# Altium schematic sheet Com.SchDoc
size A4; SheetNumber: 3; SheetTotal: 3
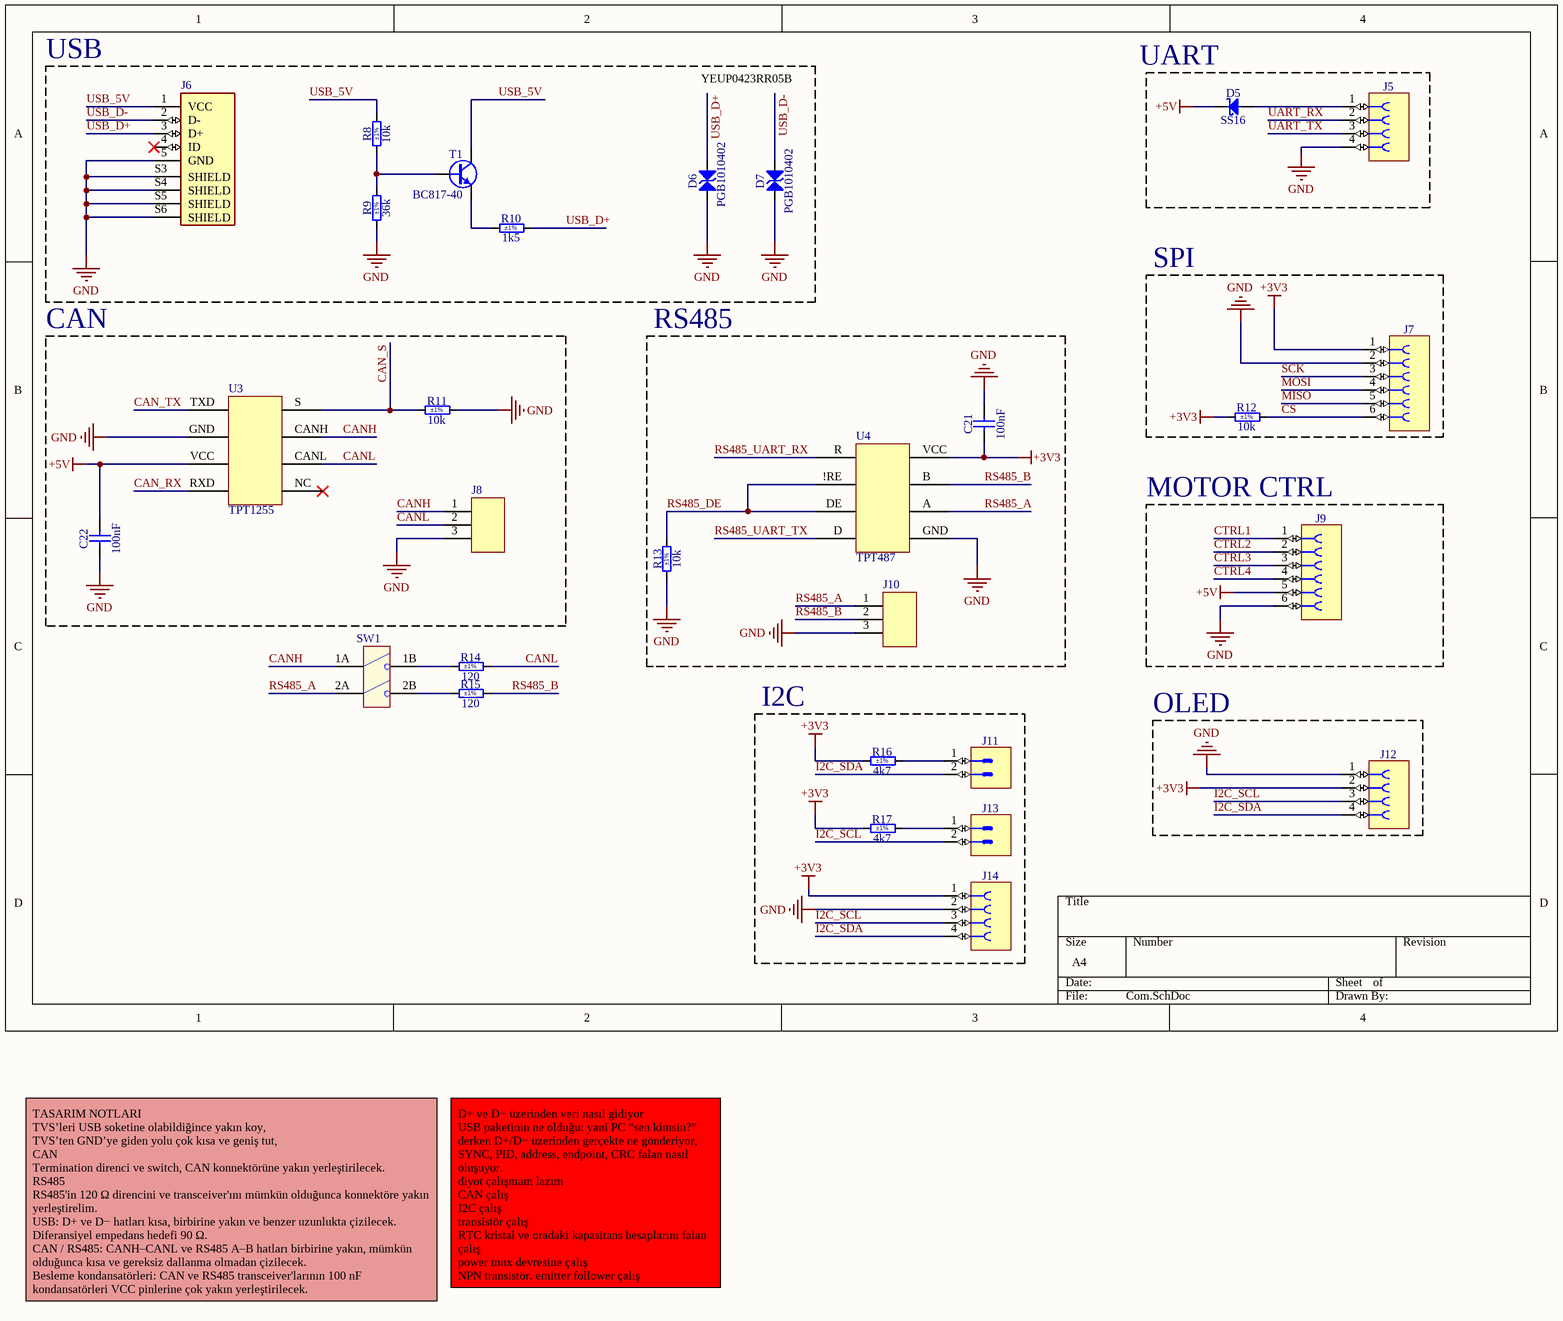
[diagram p0: Com.SchDoc]

## Parts
C21  100nF  [CAPC1608X87N]
C22  100nF  [CAPC1608X87N]
D5  SS16  [DIOM5127X229N]
D6  PGB1010402  [LITTELFUSE_PGB1010402]
D7  PGB1010402  [LITTELFUSE_PGB1010402]
J5  Socket 4  [SAMTEC_SSW-104-02-L-S]  (value not drawn)
J6  USB Micro B 5 Pin Female  [USB MICRO B]  (value not drawn)
J7  Socket 6  [SAMTEC_SSW-106-01-L-S]  (value not drawn)
J8  3 pin female header  [3 pin female hedaer]  (value not drawn)
J9  Socket 6  [SAMTEC_SSW-106-01-L-S]  (value not drawn)
J10  3 pin female header  [3 pin female hedaer]  (value not drawn)
J11  Header 2  [SAMTEC_HTSW-101-23-L-D]  (value not drawn)
J12  Socket 4  [SAMTEC_SSW-104-02-L-S]  (value not drawn)
J13  Header 2  [SAMTEC_HTSW-101-23-L-D]  (value not drawn)
J14  Socket 4  [SAMTEC_SSW-104-02-L-S]  (value not drawn)
R8  10k  Tolerance: ±1%  [RESC1608X55N]
R9  36k  Tolerance: ±1%  [RESC1608X55N]
R10  1k5  Tolerance: ±1%  [RESC1608X55N]
R11  10k  Tolerance: ±1%  [RESC1608X55N]
R12  10k  Tolerance: ±1%  [RESC1608X55N]
R13  10k  Tolerance: ±1%  [RESC1608X55N]
R14  120  Tolerance: ±1%  [RESC1608X55N]
R15  120  Tolerance: ±1%  [RESC1608X55N]
R16  4k7  Tolerance: ±1%  [RESC1608X55N]
R17  4k7  Tolerance: ±1%  [RESC1608X55N]
SW1  DS1040  [DS1040 2-DIP SW]  (value not drawn)
T1  BC817-40  [SOT95P230X110-3N]
U3  TPT1255  [TPT1255]
U4  TPT487  [TPT487]

## Blocks framed on the sheet
USB: D6 D7 J6 R8-R10 T1
SPI: J7 R12
CAN: C22 J8 R11 U3
MOTOR CTRL: J9
I2C: J11 J13 J14 R16 R17
OLED: J12

## Nets
+3V3: C21.1 J7.1 J12.2 J14.1 R12.1 R16.1 R17.1 U4.VCC
+5V: C22.2 D5.1(C) J9.5 U3.VCC
GND: C21.2 C22.1 D6.1 D7.1 J5.4 J6.5(GND) J6.S3(SHIELD) J6.S4(SHIELD) J6.S5(SHIELD) J6.S6(SHIELD) J7.2 J8.3 J9.6 J10.3 J12.1 J14.2 R9.1 R11.2 R13.1 U3.GND U4.GND
CAN_RX: U3.RXD
CAN_S: R11.1 U3.S
CAN_TX: U3.TXD
CANH: J8.1 SW1.1A(COM1) U3.CANH
CANL: J8.2 R14.2 U3.CANL
CS: J7.6 R12.2
CTRL1: J9.1
CTRL2: J9.2
CTRL3: J9.3
CTRL4: J9.4
I2C_SCL: J12.3 J13.2 J14.3
I2C_SDA: J11.2 J12.4 J14.4
MISO: J7.5
MOSI: J7.4
RS485_A: J10.1 SW1.2A(COM2) U4.A
RS485_B: J10.2 R15.2 U4.B
RS485_DE: R13.2 U4.!RE U4.DE
RS485_UART_RX: U4.R
RS485_UART_TX: U4.D
SCK: J7.3
UART_RX: J5.2
UART_TX: J5.3
USB_5V: J6.1(VCC) R8.2 T1.3(C)
USB_D+: D6.2 J6.3(D+) R10.2
USB_D-: D7.2 J6.2(D-)
NetD5_2: D5.2(A) J5.1
NetJ11_1: J11.1 R16.2
NetJ13_1: J13.1 R17.2
NetR8_1: R8.1 R9.2 T1.1(B)
NetR10_1: R10.1 T1.2(E)
NetR14_1: R14.1 SW1.1B(NO1)
NetR15_1: R15.1 SW1.2B(NO2)

Not connected (* = marked no-connect by the designer): J6 4(ID)*; U3 NC(5)*

## Notes on the sheet
- YEUP0423RR05B
- (near D5) UART
- RS485
- TASARIM NOTLARI
  TVS’leri USB soketine olabildiğince yakın koy,
  TVS’ten GND’ye giden yolu çok kısa ve geniş tut,
  CAN
  Termination direnci ve switch, CAN konnektörüne yakın yerleştirilecek.
  RS485
  RS485'in 120 Ω direncini ve transceiver'ını mümkün olduğunca konnektöre yakın yerleştirelim.
  USB: D+ ve D− hatları kısa, birbirine yakın ve benzer uzunlukta çizilecek. Diferansiyel empedans hedefi 90 Ω.
  CAN / RS485: CANH–CANL ve RS485 A–B hatları birbirine yakın, mümkün olduğunca kısa ve gereksiz dallanma olmadan çizilecek.
  Besleme kondansatörleri: CAN ve RS485 transceiver'larının 100 nF kondansatörleri VCC pinlerine çok yakın yerleştirilecek.
- D+ ve D− üzerinden veri nasıl gidiyor
  USB paketinin ne olduğu: yani PC “sen kimsin?” derken D+/D− üzerinden gerçekte ne gönderiyor, SYNC, PID, address, endpoint, CRC falan nasıl oluşuyor.
  diyot çalışmam lazım
  CAN çalış
  I2C çalış
  transistör çalış
  RTC kristal ve oradaki kapasitans hesaplarını falan çalış
  power mux devresine çalış
  NPN transistör. emitter follower çalış

## Library data of the parts
C21 C22 = CC0603_100NF_50V_10%_X5R: Non-polarised capacitor; Part Description: SMD Multilayer Chip Ceramic Capacitor; Manufacturer: GENERIC; Manufacturer1 Part Number: C1608X5R1H104K080; Voltage: 50V; TC: X5R; Tolerance: ±10%; Part Number: CC0603_100NF_50V_10%_X5R; Component Kind: Standard; Component Type: Standard; Pin Count: 2; Value: 100nF; Status: None; Manufacturer Part Number: CC0603_100NF_50V_10%_X5R; Case: 0603; Mounted: Yes; Socket: No; SMD: Yes; Sense: No; Manufacturer1 Example: TDK; Manufacturer1 ComponentHeight: 0.9mm; HelpURL: \\cern.ch\dfs\Applications\Altium\Datasheets\CC0603_X5R_TDK_C.pdf; Author: CERN DEM MR; CreateDate: 8.01.2016; LatestRevisionDate: 8.01.2016
D5 = SS16: Schottky Diode; Part Description: Surface Mount Schottky Barrier Rectifier; Manufacturer: VISHAY GENERAL SEMICONDUCTOR; Voltage: 60V; Power: 1A; PressFit: No; Bonding: No; Part Number: SS16; Component Kind: Standard; Component Type: Standard; Device: SS16; PackageDescription: DO-214-AC/SMA Diode, Molded Body; 5.10mm L X 2.67mm W X 2.29mm H, IPC Medium Density; Manufacturer Part Number: SS16; Pin Count: 2; Case: DO-214AC; Mounted: Yes; Socket: No; SMD: Yes; Sense: No; ComponentHeight: 2.29mm; HelpURL: \\cern.ch\dfs\Applications\Altium\Datasheets\SS16.pdf; Author: CERN DEM JLC; CreateDate: 15.07.2008; LatestRevisionDate: 23.08.2010
D6 D7 = PGB1010402: Transient Voltage Suppressor Diode (Bi-Directional); Part Description: Pulse-Guard ESD Surface Mount Polymeric Electrostatic Discharge Suppressor; Manufacturer: LITTELFUSE; Voltage: 12V; PressFit: No; Bonding: No; Part Number: PGB1010402; Component Kind: Standard; Component Type: Standard; Device: PGB1010402; PackageDescription: 0402, 2-Leads, Body 1mm L X 0.51mm W X 0.39mm H body; Manufacturer Part Number: PGB1010402; Pin Count: 2; Case: 0402; Mounted: Yes; Socket: No; SMD: Yes; Sense: No; ComponentHeight: 0.39mm; HelpURL: \\cern.ch\dfs\Applications\Altium\Datasheets\PGB1010402.pdf; Author: CERN DEM BC; CreateDate: 20.02.2019; LatestRevisionDate: 20.02.2019
J5 J12 J14 = SAMTEC_SSW-104-02-L-S: Connector 4 Female; Part Description: 4 Contacts, Pitch 2.54mm, Single Row Through Mount Straight Socket (Lead Length 4.93mm); Manufacturer: SAMTEC; PressFit: No; Part Number: SAMTEC_SSW-104-02-L-S; Component Kind: Standard; Component Type: Standard; Pin Count: 4; Family: Socket 4; Mounted: Yes; Socket: No; SMD: No; Sense: No; Status: None; Manufacturer Part Number: SSW-104-02-L-S; ComponentHeight: 8.51mm; HelpURL: \\cern.ch\dfs\Applications\Altium\Datasheets\SAMTEC_SSW-104-02-L-S.pdf; Author: CERN DEM JLC; CreateDate: 30.01.2012; LatestRevisionDate: 30.01.2012
J6 = L-KLS1-233-0-0-0-T: CONNECTOR USB MICRO B TYPE FEMALE SMT R/A W/O POST
J7 J9 = SAMTEC_SSW-106-01-L-S: Connector 6 Female; Part Description: 6 Contacts, Pitch 2.54mm, Single Row Through Mount Straight Socket (Lead Length 2.64mm); Manufacturer: SAMTEC; PressFit: No; Part Number: SAMTEC_SSW-106-01-L-S; Component Kind: Standard; Component Type: Standard; Pin Count: 6; Family: Socket 6; Mounted: Yes; Socket: No; SMD: No; Sense: No; Status: None; Manufacturer Part Number: SSW-106-01-L-S; ComponentHeight: 8.51mm; HelpURL: \\cern.ch\dfs\Applications\Altium\Datasheets\SAMTEC_SSW-106-01-L-S.pdf; Author: CERN DEM BC; CreateDate: 29.09.2021; LatestRevisionDate: 29.09.2021
J8 J10 = 3 Pin Female Header: 3 Pin Female Header 2.54mm pitch
J11 J13 = SAMTEC_HTSW-101-23-L-D: Connector 2 Male; Part Description: 2 Contacts, Pitch 2.54mm, Dual Row Through Mount Straight Header (Post Lead 5.84mm, Tail Lead 2.92mm, Insulator 2.54mm); Manufacturer: SAMTEC; PressFit: No; Status Comment: High Temperature; Part Number: SAMTEC_HTSW-101-23-L-D; Component Kind: Standard; Component Type: Standard; Pin Count: 2; Family: Header 2; Mounted: Yes; Socket: No; SMD: No; Sense: No; Status: Preferred; Manufacturer Part Number: HTSW-101-23-L-D; ComponentHeight: 8.38mm; HelpURL: \\cern.ch\dfs\Applications\Altium\Datasheets\SAMTEC_HTSW-101-23-L-D.pdf; Author: CERN DEM JLC; CreateDate: 22.02.2018; LatestRevisionDate: 22.02.2018
R8 R11-R13 = R0603_10K_1%_0.1W_100PPM: Resistor - 1%; Part Description: General Purpose Thick Film Chip Resistor; Manufacturer: GENERIC; Manufacturer1 Part Number: NRC06F1002TRF; Power: 0.1W; TC: ±100ppm/°C; PressFit: No; Part Number: R0603_10K_1%_0.1W_100PPM; Component Kind: Standard; Component Type: Standard; Pin Count: 2; Value: 10k; Status: Preferred; Manufacturer Part Number: R0603_10K_1%_0.1W_100PPM; Case: 0603; Mounted: Yes; Sense: No; Socket: No; SMD: Yes; Manufacturer1 Example: NIC COMPONENT; Manufacturer1 ComponentHeight: 0.55mm; HelpURL: \\cern.ch\dfs\Applications\Altium\Datasheets\R0603_NIC_NRC.pdf; Author: CERN DEM JLC; CreateDate: 3.12.2007; LatestRevisionDate: 13.03.2008
R9 = R0603_36K_1%_0.1W_100PPM: Resistor - 1%; Part Description: General Purpose Thick Film Chip Resistor; Manufacturer: GENERIC; Manufacturer1 Part Number: NRC06F3602TRF; Power: 0.1W; TC: ±100ppm/°C; PressFit: No; Part Number: R0603_36K_1%_0.1W_100PPM; Component Kind: Standard; Component Type: Standard; Pin Count: 2; Value: 36k; Status: Preferred; Manufacturer Part Number: R0603_36K_1%_0.1W_100PPM; Case: 0603; Mounted: Yes; Sense: No; Socket: No; SMD: Yes; Manufacturer1 Example: NIC COMPONENT; Manufacturer1 ComponentHeight: 0.55mm; HelpURL: \\cern.ch\dfs\Applications\Altium\Datasheets\R0603_NIC_NRC.pdf; Author: CERN DEM JLC; CreateDate: 3.12.2007; LatestRevisionDate: 13.03.2008
R10 = R0603_1K5_1%_0.1W_100PPM: Resistor - 1%; Part Description: General Purpose Thick Film Chip Resistor; Manufacturer: GENERIC; Manufacturer1 Part Number: NRC06F1501TRF; Power: 0.1W; TC: ±100ppm/°C; PressFit: No; Part Number: R0603_1K5_1%_0.1W_100PPM; Component Kind: Standard; Component Type: Standard; Pin Count: 2; Value: 1k5; Status: Preferred; Manufacturer Part Number: R0603_1K5_1%_0.1W_100PPM; Case: 0603; Mounted: Yes; Sense: No; Socket: No; SMD: Yes; Manufacturer1 Example: NIC COMPONENT; Manufacturer1 ComponentHeight: 0.55mm; HelpURL: \\cern.ch\dfs\Applications\Altium\Datasheets\R0603_NIC_NRC.pdf; Author: CERN DEM JLC; CreateDate: 3.12.2007; LatestRevisionDate: 13.03.2008
R14 R15 = R0603_120R_1%_0.1W_100PPM: Resistor - 1%; Part Description: General Purpose Thick Film Chip Resistor; Manufacturer: GENERIC; Manufacturer1 Part Number: NRC06F1200TRF; Power: 0.1W; TC: ±100ppm/°C; PressFit: No; Part Number: R0603_120R_1%_0.1W_100PPM; Component Kind: Standard; Component Type: Standard; Pin Count: 2; Value: 120; Status: Preferred; Manufacturer Part Number: R0603_120R_1%_0.1W_100PPM; Case: 0603; Mounted: Yes; Sense: No; Socket: No; SMD: Yes; Manufacturer1 Example: NIC COMPONENT; Manufacturer1 ComponentHeight: 0.55mm; HelpURL: \\cern.ch\dfs\Applications\Altium\Datasheets\R0603_NIC_NRC.pdf; Author: CERN DEM JLC; CreateDate: 3.12.2007; LatestRevisionDate: 13.03.2008
R16 R17 = R0603_4K7_1%_0.1W_100PPM: Resistor - 1%; Part Description: General Purpose Thick Film Chip Resistor; Manufacturer: GENERIC; Manufacturer1 Part Number: NRC06F4701TRF; Power: 0.1W; TC: ±100ppm/°C; PressFit: No; Part Number: R0603_4K7_1%_0.1W_100PPM; Component Kind: Standard; Component Type: Standard; Pin Count: 2; Value: 4k7; Status: Preferred; Manufacturer Part Number: R0603_4K7_1%_0.1W_100PPM; Case: 0603; Mounted: Yes; Sense: No; Socket: No; SMD: Yes; Manufacturer1 Example: NIC COMPONENT; Manufacturer1 ComponentHeight: 0.55mm; HelpURL: \\cern.ch\dfs\Applications\Altium\Datasheets\R0603_NIC_NRC.pdf; Author: CERN DEM JLC; CreateDate: 3.12.2007; LatestRevisionDate: 13.03.2008
SW1 = DS1040 2-DIP SW: SWITCH DIP 2 Pos. SPST 100mA 24VDC THT V/T
T1 = BC817-40: NPN Transistor; Part Description: 45V 500mA NPN General-Purpose Transistor; Manufacturer: NXP SEMICONDUCTORS; PressFit: No; Bonding: No; Part Number: BC817-40; Component Kind: Standard; Component Type: Standard; Device: BC817-40; PackageDescription: SOT23, 0.95mm Pitch; 3 Pin, 1.30mm W X 2.90mm L X 1.10mm H body, IPC Medium Density; Manufacturer Part Number: BC817-40; Pin Count: 3; Case: SOT23-3; Mounted: Yes; Socket: No; SMD: Yes; Sense: No; ComponentHeight: 1.1mm; HelpURL: \\cern.ch\dfs\Applications\Altium\Datasheets\BC817-40.pdf; Author: CERN DEM BC; CreateDate: 29.04.2020; LatestRevisionDate: 29.04.2020
U3 = TPT1255 CAN TRANSCIEVER: IC-1255 TRANSCEIVER CAN 8-SOP
U4 = TPT487 RS485 Transciever: IC-487 TRANSCEIVER 1/1 8-SOP